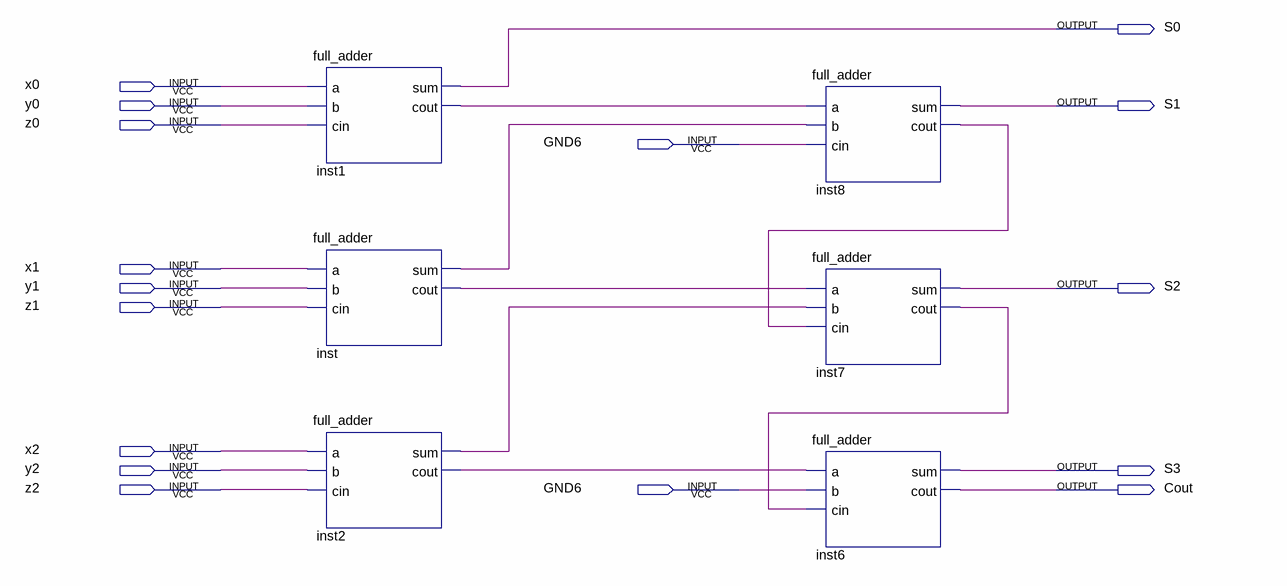
[diagram p0: schematic sheet]
// Quartus schematic 3-bit_CSA.bdf as structural Verilog: 6 symbols, 16 pins
module \3-bit_CSA  (
  input  x0,
  input  y0,
  input  z0,
  input  GND6,
  input  x1,
  input  y1,
  input  z1,
  input  x2,
  input  y2,
  input  z2,
  output S0,
  output S1,
  output S2,
  output S3,
  output Cout
);

  wire inst1_cout, inst2_cout, inst2_sum, inst7_cout, inst8_cout, inst_cout, inst_sum;

  full_adder inst1 (.a(x0), .b(y0), .cin(z0), .sum(S0), .cout(inst1_cout));
  full_adder inst (.a(x1), .b(y1), .cin(z1), .sum(inst_sum), .cout(inst_cout));
  full_adder inst2 (.a(x2), .b(y2), .cin(z2), .sum(inst2_sum), .cout(inst2_cout));
  full_adder inst8 (.a(inst1_cout), .b(inst_sum), .cin(GND6), .sum(S1), .cout(inst8_cout));
  full_adder inst7 (.a(inst_cout), .b(inst2_sum), .cin(inst8_cout), .sum(S2), .cout(inst7_cout));
  full_adder inst6 (.a(inst2_cout), .b(GND6), .cin(inst7_cout), .sum(S3), .cout(Cout));
endmodule
